# Altium schematic sheet Buttons_Section_2.SchDoc
size A4; DocumentNumber: 4; SheetNumber: 4; SheetTotal: 6
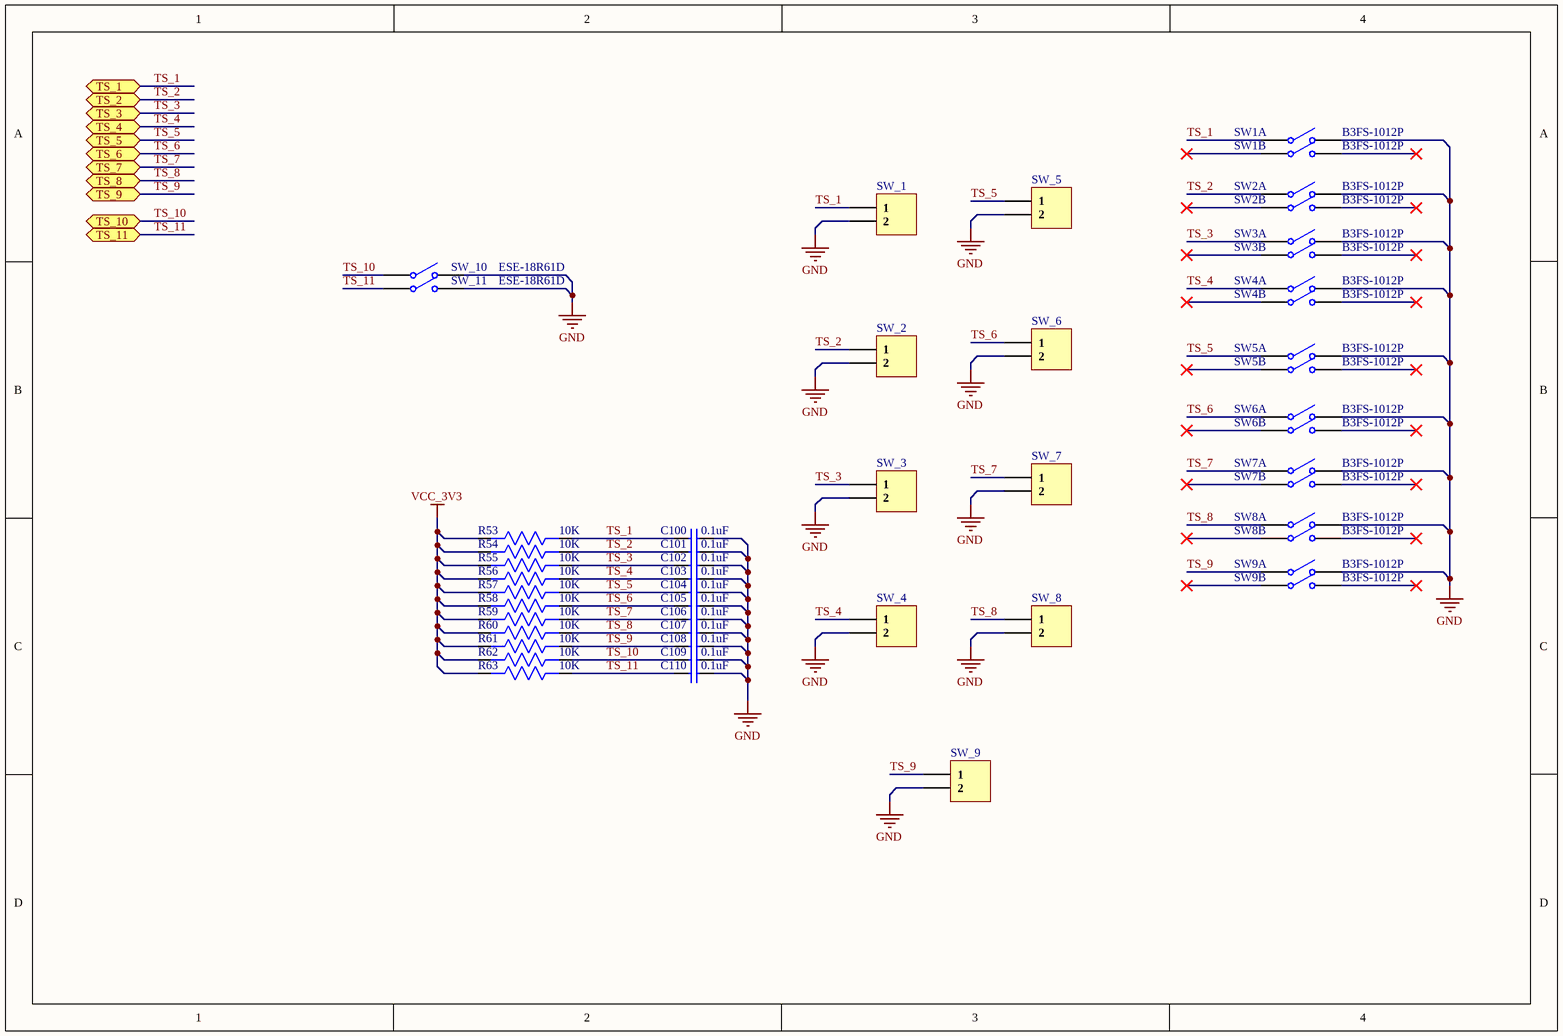
[diagram p0: Buttons_Section_2.SchDoc]

## Parts
C100  0.1uF  [Cap0402]
C101  0.1uF  [Cap0402]
C102  0.1uF  [Cap0402]
C103  0.1uF  [Cap0402]
C104  0.1uF  [Cap0402]
C105  0.1uF  [Cap0402]
C106  0.1uF  [Cap0402]
C107  0.1uF  [Cap0402]
C108  0.1uF  [Cap0402]
C109  0.1uF  [Cap0402]
C110  0.1uF  [Cap0402]
R53  10K  [Res0402]
R54  10K  [Res0402]
R55  10K  [Res0402]
R56  10K  [Res0402]
R57  10K  [Res0402]
R58  10K  [Res0402]
R59  10K  [Res0402]
R60  10K  [Res0402]
R61  10K  [Res0402]
R62  10K  [Res0402]
R63  10K  [Res0402]
SW1  B3FS-1012P  [B3FS-1012P]  (parts A,B of 2)
SW2  B3FS-1012P  [B3FS-1012P]  (parts A,B of 2)
SW3  B3FS-1012P  [B3FS-1012P]  (parts A,B of 2)
SW4  B3FS-1012P  [B3FS-1012P]  (parts A,B of 2)
SW5  B3FS-1012P  [B3FS-1012P]  (parts A,B of 2)
SW6  B3FS-1012P  [B3FS-1012P]  (parts A,B of 2)
SW7  B3FS-1012P  [B3FS-1012P]  (parts A,B of 2)
SW8  B3FS-1012P  [B3FS-1012P]  (parts A,B of 2)
SW9  B3FS-1012P  [B3FS-1012P]  (parts A,B of 2)
SW_1  61300211121  [HDR1X2]  (value not drawn)
SW_2  61300211121  [HDR1X2]  (value not drawn)
SW_3  61300211121  [HDR1X2]  (value not drawn)
SW_4  61300211121  [HDR1X2]  (value not drawn)
SW_5  61300211121  [HDR1X2]  (value not drawn)
SW_6  61300211121  [HDR1X2]  (value not drawn)
SW_7  61300211121  [HDR1X2]  (value not drawn)
SW_8  61300211121  [HDR1X2]  (value not drawn)
SW_9  61300211121  [HDR1X2]  (value not drawn)
SW_10  ESE-18R61D  [ESE-18R61D]
SW_11  ESE-18R61D  [ESE-18R61D]

## Ports
TS_1 (bidir), TS_2 (bidir), TS_3 (bidir), TS_4 (bidir), TS_5 (bidir), TS_6 (bidir), TS_7 (bidir), TS_8 (bidir), TS_9 (bidir), TS_10 (bidir), TS_11 (bidir)

## Nets
GND: C100.2 C101.2 C102.2 C103.2 C104.2 C105.2 C106.2 C107.2 C108.2 C109.2 C110.2 SW1.3 SW2.3 SW3.3 SW4.3 SW5.3 SW6.3 SW7.3 SW8.3 SW9.3 SW_1.2 SW_2.2 SW_3.2 SW_4.2 SW_5.2 SW_6.2 SW_7.2 SW_8.2 SW_9.2 SW_10.2 SW_11.2
VCC_3V3: R53.2 R54.2 R55.2 R56.2 R57.2 R58.2 R59.2 R60.2 R61.2 R62.2 R63.2
TS_1: C100.1 R53.1 SW1.1 SW_1.1 ; port TS_1
TS_2: C101.1 R54.1 SW2.1 SW_2.1 ; port TS_2
TS_3: C102.1 R55.1 SW3.1 SW_3.1 ; port TS_3
TS_4: C103.1 R56.1 SW4.1 SW_4.1 ; port TS_4
TS_5: C104.1 R57.1 SW5.1 SW_5.1 ; port TS_5
TS_6: C105.1 R58.1 SW6.1 SW_6.1 ; port TS_6
TS_7: C106.1 R59.1 SW7.1 SW_7.1 ; port TS_7
TS_8: C107.1 R60.1 SW8.1 SW_8.1 ; port TS_8
TS_9: C108.1 R61.1 SW9.1 SW_9.1 ; port TS_9
TS_10: C109.1 R62.1 SW_10.1 ; port TS_10
TS_11: C110.1 R63.1 SW_11.1 ; port TS_11

Not connected (* = marked no-connect by the designer): SW1 2* 4*; SW2 2* 4*; SW3 2* 4*; SW4 2* 4*; SW5 2* 4*; SW6 2* 4*; SW7 2* 4*; SW8 2* 4*; SW9 2* 4*

## Library data of the parts
C100-C110 = CC0402KRX7R7BB104: CAP CER 0.1UF 16V X7R 0402; Manufacturer: Yageo; Tolerance: 10%; Capacitance: 100nF; Supplier 1: Digi-Key; Manufacturer Part Number: CC0402KRX7R7BB104; Stock 1: 16982736; Pricing 1: 1=0.1, 10=0.034, 100=0.015, 500=0.0107, 1000=0.00841, 2500=0.00764, 5000=0.00703 (USD); Mount: Surface Mount; Case/Package: 0402; Number of Pins: 2; Case Code (Metric): 1005; Case Code (Imperial): 0402; Min Operating Temperature: -55°C; Max Operating Temperature: 125°C; Dielectric: X7R; Voltage Rating: 16V; Voltage Rating (DC): 16V; Packaging: Tape and Reel; Package Quantity: 1; Termination: SMD/SMT; Composition: Ceramic; Voltage: 16V; Length: 1mm; Height: 0.5mm; Width: 0.02inch; Thickness: 0.022inch; Depth: 0.5mm; Radiation Hardening: No; REACH SVHC: No SVHC; Lead Free: Lead Free; Halogen Free: Halogen Free; ComponentLink1URL: http://www.yageo.com/documents/recent/UPY-GPHC_X7R_6.3V-to-50V_8.pdf?src-supplier=Avnet+Europe; ComponentLink1Description: http://www.yageo.com/documents/recent/UPY-GPHC_X7R_6.3V-to-50V_8.pdf?src-supplier=Avnet+Europe; ComponentLink2URL: http://www.yageo.com/documents/recent/UPY-GPHC_X7R_6.3V-to-50V_18.pdf?src-supplier=Digi-Key; ComponentLink2Description: http://www.yageo.com/documents/recent/UPY-GPHC_X7R_6.3V-to-50V_18.pdf?src-supplier=Digi-Key; ComponentLink3URL: http://www.yageo.com/documents/recent/UPY-GPHC_X7R_6.3V-to-50V_8.pdf?src-supplier=Avnet; ComponentLink3Description: http://www.yageo.com/documents/recent/UPY-GPHC_X7R_6.3V-to-50V_8.pdf?src-supplier=Avnet; ComponentLink4URL: http://www.yageo.com/documents/recent/UPY-GPHC_X7R_6.3V-to-50V_18.pdf?src-supplier=Mouser; ComponentLink4Description: http://www.yageo.com/documents/recent/UPY-GPHC_X7R_6.3V-to-50V_18.pdf?src-supplier=Mouser; ComponentLink5URL: http://www.farnell.com/datasheets/2167236.pdf?src-supplier=Element14; ComponentLink5Description: http://www.farnell.com/datasheets/2167236.pdf?src-supplier=Element14; ComponentLink6URL: http://www.farnell.com/datasheets/1489800.pdf?src-supplier=Element14; ComponentLink6Description: http://www.farnell.com/datasheets/1489800.pdf?src-supplier=Element14; Supplier Part Number 1: 311-1338-1-ND
R53-R63 = RK73B1ETTP103J: RES 10K OHM 5% 1/10W 0402; Manufacturer: KOA Speer; Resistance: 10kR; Power Rating: 63mW; Voltage Rating: 50V; Temperature Coefficient: 200ppm/°C; Supplier 1: Digi-Key; Manufacturer Part Number: RK73B1ETTP103J; Stock 1: 2917894; Pricing 1: 1=0.1, 10=0.016, 100=0.0065, 1000=0.00292, 2500=0.00253, 5000=0.00209 (USD); Mount: Surface Mount; Case/Package: 0402; Case Code (Imperial): 0402; Case Code (Metric): 1005; Min Operating Temperature: -55°C; Max Operating Temperature: 155°C; Packaging: Tape and Reel; Tolerance: 5%; Package Quantity: 10000; Composition: Thick Film; Termination: SMD/SMT; Military Standard: Not; Voltage Rating (DC): 50V; Length: 1mm; Height: 0.35mm; Width: 0.5mm; Depth: 0.5mm; Lead Free: Lead Free; ComponentLink1URL: https://www.verical.com/server-webapp/html/getDatasheet?partID=89073&src-supplier=Verical; ComponentLink1Description: https://www.verical.com/server-webapp/html/getDatasheet?partID=89073&src-supplier=Verical; Supplier Part Number 1: 2019-RK73B1ETTP103JCT-ND
SW1-SW9 = B3FS-1012P: SWITCH TACTILE SPST-NO 0.05A 24V; Manufacturer: Omron; Mechanical Life: 300000Cycles; Throw Configuration: SPST; Contact Resistance: 100mR; Operating Force: 1.47N; Current Rating: 50mA; Illumination Type: Non-Illuminated; Switch Travel: 0.25mm; Switch Function: Off-Mom; Actuator Type: Standard; Actuator Length: 1.7mm; Supplier 1: Digi-Key; Manufacturer Part Number: B3FS-1012P; Stock 1: 177804; Pricing 1: 1=0.59, 10=0.569, 25=0.548, 100=0.4741, 250=0.43192, 500=0.40034 (USD); Mount: Surface Mount; Case/Package: SMD/SMT; Weight: 0.2g; Contact Plating: Silver; Min Operating Temperature: -20°C; Max Operating Temperature: 70°C; Voltage Rating (DC): 24V; Packaging: Tape and Reel; Max Voltage Rating (DC): 24V; Package Quantity: 1; Max Current Rating: 50mA; Termination: Gull Wing; Electrical Life: 300000Cycles; Orientation: Straight; Length: 6.3mm; Depth: 8mm; Radiation Hardening: No; ComponentLink1URL: https://omronfs.omron.com/en_US/ecb/products/pdf/en-b3fs.pdf?src-supplier=Digi-Key; ComponentLink1Description: https://omronfs.omron.com/en_US/ecb/products/pdf/en-b3fs.pdf?src-supplier=Digi-Key; ComponentLink2URL: http://omronfs.omron.com/en_US/ecb/products/pdf/en-b3fs.pdf?src-supplier=Digi-Key; ComponentLink2Description: http://omronfs.omron.com/en_US/ecb/products/pdf/en-b3fs.pdf?src-supplier=Digi-Key; Supplier Part Number 1: SW1237CT-ND
SW_1-SW_9 = Header 1x2: CONN HEADER VERT 2POS 2.54MM; Manufacturer: Wurth Electronics; Current Rating: 3A; Voltage Rating: 250V; Number of Positions: 2; Gender: Male; Connector Type: Male Pin; Pitch: 0.1inch; Supplier 1: Digi-Key; Manufacturer Part Number: 61300211121; Stock 1: 219205; Pricing 1: 1=0.13, 10=0.106, 25=0.088, 50=0.074, 100=0.067, 1000=0.061 (USD); Mount: Through Hole; Contact Plating: Gold; Housing Material: PBT; Contact Material: Copper Alloy,Copper; Color: Black; Min Operating Temperature: -40°C; Max Operating Temperature: 125°C; Number of Rows: 1; Contact Gender: Male; Packaging: Bulk; Termination: Through Hole; Number of Contacts: 2; Contact Mating Length: 0.236inch; REACH SVHC: Unknown; Lead Free: Lead Free; ComponentLink1URL: http://www.mouser.com/ds/2/445/6130xx11121-538006.pdf?src-supplier=Mouser; ComponentLink1Description: http://www.mouser.com/ds/2/445/6130xx11121-538006.pdf?src-supplier=Mouser; Supplier Part Number 1: 732-5315-ND
SW_10 SW_11 = ESE-18R61D: SWITCH DETECTOR SPST-NC 10MA 5V; Manufacturer: Panasonic; Mechanical Life: 50000Cycles; Throw Configuration: SPST; Contact Resistance: 500mR; Operating Force: 0.3N; Operating Position: 0.102inch; Switch Function: On-Mom; Actuator Type: Lever; Actuator Length: 2.15mm; Supplier 1: Digi-Key; Manufacturer Part Number: ESE-18R61D; Stock 1: 39873; Pricing 1: 1=1, 10=0.962, 25=0.8992, 100=0.7807, 250=0.7104, 500=0.6586, 1000=0.6105, 2500=0.555 (USD); Mount: Surface Mount; Number of Terminals: 2; Min Operating Temperature: -10°C; Max Operating Temperature: 60°C; Voltage Rating (DC): 5V; Packaging: Tape and Reel; Max Voltage Rating (DC): 5V; Package Quantity: 1; Contact Current Rating: 10mA; Current Rating: 10mA; Termination: SMD/SMT; Electrical Life: 50000Cycles; Orientation: Right Angle; Height: 1.2mm; Width: 4mm; REACH SVHC: No SVHC; Lead Free: Lead Free; ComponentLink1URL: https://industrial.panasonic.com/cdbs/www-data/pdf/ATB0000/ATB0000C8.pdf?src-supplier=Digi-Key; ComponentLink1Description: https://industrial.panasonic.com/cdbs/www-data/pdf/ATB0000/ATB0000C8.pdf?src-supplier=Digi-Key; ComponentLink2URL: http://www.farnell.com/datasheets/1520574.pdf?src-supplier=Newark; ComponentLink2Description: http://www.farnell.com/datasheets/1520574.pdf?src-supplier=Newark; ComponentLink3URL: https://www.distrelec.biz/Web/Downloads/_t/ds/ese18_eng_tds.pdf?mime=application%2Fpdf&src-supplier=Distrelec; ComponentLink3Description: https://www.distrelec.biz/Web/Downloads/_t/ds/ese18_eng_tds.pdf?mime=application%2Fpdf&src-supplier=Distrelec; ComponentLink4URL: http://www.farnell.com/datasheets/1728953.pdf?src-supplier=Element14; ComponentLink4Description: http://www.farnell.com/datasheets/1728953.pdf?src-supplier=Element14; Supplier Part Number 1: P13373SCT-ND